# Altium schematic sheet Mikro_Bus.SchDoc
size A4; DocumentNumber: 11; SheetNumber: 11; SheetTotal: 12
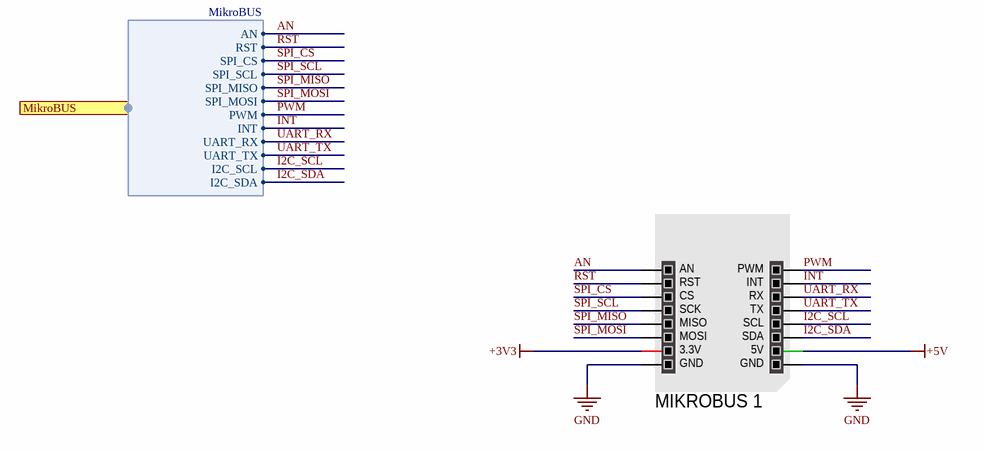
[diagram p0: Mikro_Bus.SchDoc]

## Parts
MIKROBUS_1  MIKROBUS HOST CONN.  [MIKROBUS HOST CONN. SMD]  (value not drawn)

## Ports
MikroBUS (harness MikroBUS, see MAIN[3A], MCU[1C])

## Harnesses
MikroBUS: AN, RST, SPI_CS, SPI_SCL, SPI_MISO, SPI_MOSI, PWM, INT, UART_RX, UART_TX, I2C_SCL, I2C_SDA

## Nets
+3V3: MIKROBUS_1.7(3.3V)
+5V: MIKROBUS_1.10(5V)
GND: MIKROBUS_1.8(GND) MIKROBUS_1.9(GND)
AN: MIKROBUS_1.1(AN) ; port MikroBUS.AN
I2C_SCL: MIKROBUS_1.12(SCL) ; port MikroBUS.I2C_SCL
I2C_SDA: MIKROBUS_1.11(SDA) ; port MikroBUS.I2C_SDA
INT: MIKROBUS_1.15(INT) ; port MikroBUS.INT
PWM: MIKROBUS_1.16(PWM) ; port MikroBUS.PWM
RST: MIKROBUS_1.2(RST) ; port MikroBUS.RST
SPI_CS: MIKROBUS_1.3(CS) ; port MikroBUS.SPI_CS
SPI_MISO: MIKROBUS_1.5(MISO) ; port MikroBUS.SPI_MISO
SPI_MOSI: MIKROBUS_1.6(MOSI) ; port MikroBUS.SPI_MOSI
SPI_SCL: MIKROBUS_1.4(SCK) ; port MikroBUS.SPI_SCL
UART_RX: MIKROBUS_1.14(RX) ; port MikroBUS.UART_RX
UART_TX: MIKROBUS_1.13(TX) ; port MikroBUS.UART_TX

## Notes on the sheet
- Project:
- Drawing number:
- Date:
- 1
- Rev:
- Format:
- A4
- Laboratory:
- Drawn by:
- Sheet:
- Page:
- of
- File:

## Library data of the parts
MIKROBUS_1 = MIKROBUS HOST CONN._1: mikroBUS Host Socket; SMD: No; Supplier: DigiKey; Supplier Part Number: 1471-MIKROE-5210-ND